# Altium schematic sheet pressure-transmitter.SchDoc
size A4; SheetNumber: 5; SheetTotal: 14
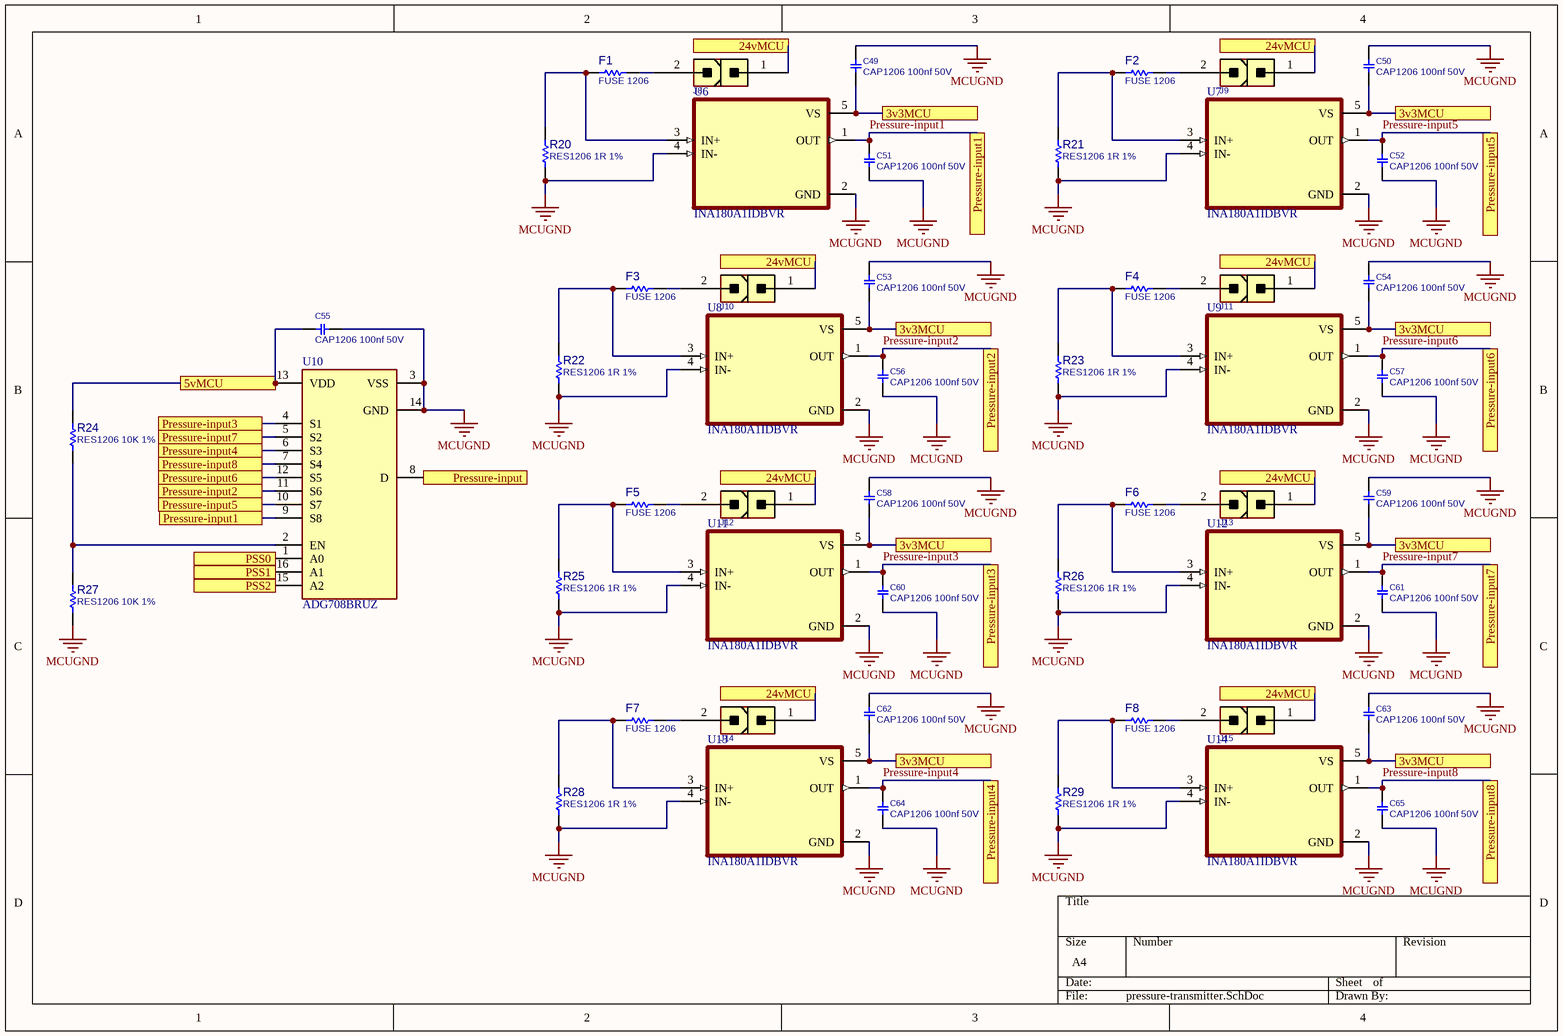
[diagram p0: pressure-transmitter.SchDoc]

## Parts
C49  CAP1206 100nf 50V  [C1206]
C50  CAP1206 100nf 50V  [C1206]
C51  CAP1206 100nf 50V  [C1206]
C52  CAP1206 100nf 50V  [C1206]
C53  CAP1206 100nf 50V  [C1206]
C54  CAP1206 100nf 50V  [C1206]
C55  CAP1206 100nf 50V  [C1206]
C56  CAP1206 100nf 50V  [C1206]
C57  CAP1206 100nf 50V  [C1206]
C58  CAP1206 100nf 50V  [C1206]
C59  CAP1206 100nf 50V  [C1206]
C60  CAP1206 100nf 50V  [C1206]
C61  CAP1206 100nf 50V  [C1206]
C62  CAP1206 100nf 50V  [C1206]
C63  CAP1206 100nf 50V  [C1206]
C64  CAP1206 100nf 50V  [C1206]
C65  CAP1206 100nf 50V  [C1206]
F1  FUSE 1206  [R1206]
F2  FUSE 1206  [R1206]
F3  FUSE 1206  [R1206]
F4  FUSE 1206  [R1206]
F5  FUSE 1206  [R1206]
F6  FUSE 1206  [R1206]
F7  FUSE 1206  [R1206]
F8  FUSE 1206  [R1206]
J8  CONN_ATXPWR_2  [ATXPWR_2]  (value not drawn)
J9  CONN_ATXPWR_2  [ATXPWR_2]  (value not drawn)
J10  CONN_ATXPWR_2  [ATXPWR_2]  (value not drawn)
J11  CONN_ATXPWR_2  [ATXPWR_2]  (value not drawn)
J12  CONN_ATXPWR_2  [ATXPWR_2]  (value not drawn)
J13  CONN_ATXPWR_2  [ATXPWR_2]  (value not drawn)
J14  CONN_ATXPWR_2  [ATXPWR_2]  (value not drawn)
J15  CONN_ATXPWR_2  [ATXPWR_2]  (value not drawn)
R20  RES1206 1R 1%  [R1206]
R21  RES1206 1R 1%  [R1206]
R22  RES1206 1R 1%  [R1206]
R23  RES1206 1R 1%  [R1206]
R24  RES1206 10K 1%  [R1206]
R25  RES1206 1R 1%  [R1206]
R26  RES1206 1R 1%  [R1206]
R27  RES1206 10K 1%  [R1206]
R28  RES1206 1R 1%  [R1206]
R29  RES1206 1R 1%  [R1206]
U6  INA180A1IDBVR  [SOT95P280X145-5N]
U7  INA180A1IDBVR  [SOT95P280X145-5N]
U8  INA180A1IDBVR  [SOT95P280X145-5N]
U9  INA180A1IDBVR  [SOT95P280X145-5N]
U10  ADG708BRUZ  [TSSOP16]
U11  INA180A1IDBVR  [SOT95P280X145-5N]
U12  INA180A1IDBVR  [SOT95P280X145-5N]
U13  INA180A1IDBVR  [SOT95P280X145-5N]
U14  INA180A1IDBVR  [SOT95P280X145-5N]

## Ports
3v3MCU, 5vMCU, 24vMCU, Pressure-input, Pressure-input1, Pressure-input2, Pressure-input3, Pressure-input4, Pressure-input5, Pressure-input6, Pressure-input7, Pressure-input8, PSS0, PSS1, PSS2

## Nets
MCUGND: C49.1 C50.1 C51.2 C52.2 C53.1 C54.1 C55.1 C56.2 C57.2 C58.1 C59.1 C60.2 C61.2 C62.1 C63.1 C64.2 C65.2 R20.2 R21.2 R22.2 R23.2 R25.2 R26.2 R27.2 R28.2 R29.2 U6.2(GND) U6.4(IN-) U7.2(GND) U7.4(IN-) U8.2(GND) U8.4(IN-) U9.2(GND) U9.4(IN-) U10.3(VSS) U10.14(GND) U11.2(GND) U11.4(IN-) U12.2(GND) U12.4(IN-) U13.2(GND) U13.4(IN-) U14.2(GND) U14.4(IN-)
3v3MCU: C49.2 C50.2 C53.2 C54.2 C58.2 C59.2 C62.2 C63.2 U6.5(VS) U7.5(VS) U8.5(VS) U9.5(VS) U11.5(VS) U12.5(VS) U13.5(VS) U14.5(VS) ; port 3v3MCU
5vMCU: C55.2 R24.1 U10.13(VDD) ; port 5vMCU
24vMCU: J8.1 J9.1 J10.1 J11.1 J12.1 J13.1 J14.1 J15.1 ; port 24vMCU
Pressure-input: U10.8(D) ; port Pressure-input
Pressure-input1: C51.1 U6.1(OUT) U10.9(S8) ; port Pressure-input1
Pressure-input2: C56.1 U8.1(OUT) U10.11(S6) ; port Pressure-input2
Pressure-input3: C60.1 U10.4(S1) U11.1(OUT) ; port Pressure-input3
Pressure-input4: C64.1 U10.6(S3) U13.1(OUT) ; port Pressure-input4
Pressure-input5: C52.1 U7.1(OUT) U10.10(S7) ; port Pressure-input5
Pressure-input6: C57.1 U9.1(OUT) U10.12(S5) ; port Pressure-input6
Pressure-input7: C61.1 U10.5(S2) U12.1(OUT) ; port Pressure-input7
Pressure-input8: C65.1 U10.7(S4) U14.1(OUT) ; port Pressure-input8
PSS0: U10.1(A0) ; port PSS0
PSS1: U10.16(A1) ; port PSS1
PSS2: U10.15(A2) ; port PSS2
NetF1_1: F1.1 R20.1 U6.3(IN+)
NetF1_2: F1.2 J8.2
NetF2_1: F2.1 R21.1 U7.3(IN+)
NetF2_2: F2.2 J9.2
NetF3_1: F3.1 R22.1 U8.3(IN+)
NetF3_2: F3.2 J10.2
NetF4_1: F4.1 R23.1 U9.3(IN+)
NetF4_2: F4.2 J11.2
NetF5_1: F5.1 R25.1 U11.3(IN+)
NetF5_2: F5.2 J12.2
NetF6_1: F6.1 R26.1 U12.3(IN+)
NetF6_2: F6.2 J13.2
NetF7_1: F7.1 R28.1 U13.3(IN+)
NetF7_2: F7.2 J14.2
NetF8_1: F8.1 R29.1 U14.3(IN+)
NetF8_2: F8.2 J15.2
NetR24_2: R24.2 R27.1 U10.2(EN)

## Library data of the parts
C49-C65 = CAP_SMD_MLCC_1206: CAP, MLCC; PARAM: -, -%; MANF_P#: MANF_PART#; PARAM2: -V; PRICE: 100= 1$; MANF: -; ASSEMBLY: ASSEMBLY
F1-F8 R20-R29 = RES_SMD_1206: RESISTOR, SMD; PARAM: 1%, 0.25W; DESC: DESCRIPTION; DIST#: MOUSER; MANF_P#: -; MANF: -; ASSEMBLY: ASSEMBLY; PRICE: -; PARAM2: -
J8-J15 = CONN_ATXPWR_2: CONN, ATX POWER, 2 P; MANF: Molex; MANF_P#: 39281023; VALUE: CONN_ATXPWR_2; MountType: THD; PACKAGE: ATXPWR-2pin; Part Type: Conn.
U6-U9 U11-U14 = INA180A1IDBVR: 26V, 350kHz current sense amplifier; MF: Texas Instruments; SnapEDA_Link: https://www.snapeda.com/parts/INA180A1IDBVR/Texas+Instruments/view-part/?ref=snap; Package: SOT-23-5 Texas Instruments; Value: *; MP: INA180A1IDBVR; Check_prices: https://www.snapeda.com/parts/INA180A1IDBVR/Texas+Instruments/view-part/?ref=eda
U10 = ADG708BRUZ: 1 Circuit IC Switch 8:1 4.5Ohm 16-TSSOP; MP: ADG708BRUZ-REEL7; MF: Analog Devices; Price: None; Availability: Good; SnapEDA_Link: https://www.snapeda.com/parts/ADG708BRUZ-REEL7/Analog%20Devices%20Inc./view-part/1237689/?ref=snap; Value: *; Check_prices: https://www.snapeda.com/parts/ADG708BRUZ-REEL7/Analog%20Devices%20Inc./view-part/1237689/?ref=eda; Package: TSSOP-16 Analog Devices; Purchase-URL: https://pricing.snapeda.com/search/part/ADG708BRUZ-REEL7/?ref=eda